# EAGLE design ISL8_XTOOLS (EAGLE 6.1)
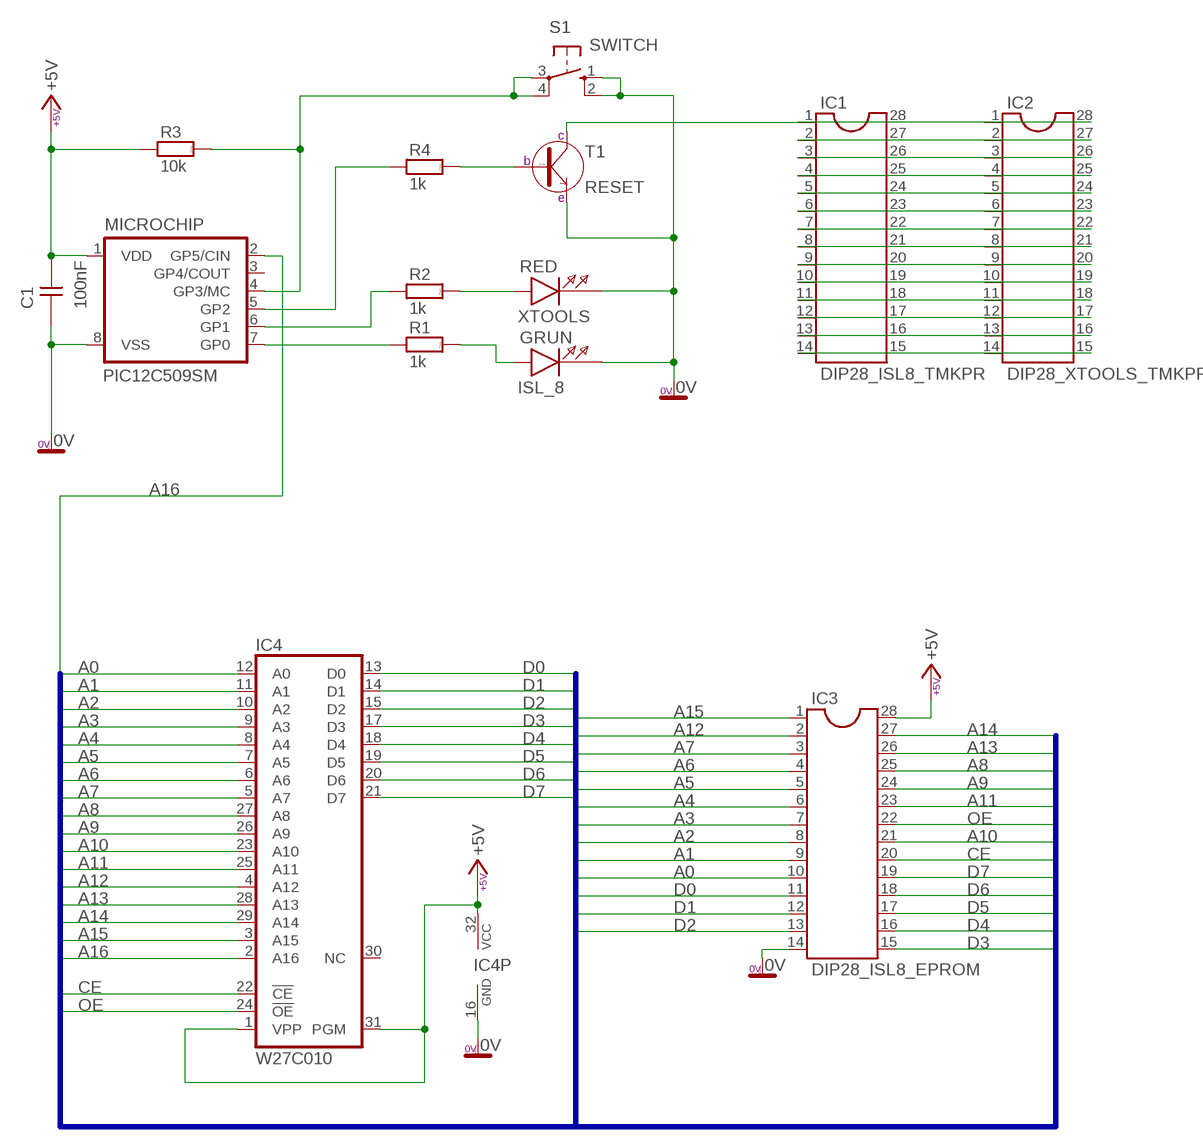
[diagram p0: schematic, sheet 1]

## Parts
C1  100nF  CK+  [1206]
GRUN  ISL_8  L-HSMG-C67  [HSMC670]
IC1  DIP28_ISL8_TMKPR  DIL28  [DIL28-6]
IC2  DIP28_XTOOLS_TMKPR  DIL28  [DIL28-6]
IC3  DIP28_ISL8_EPROM  DIL28  [DIL28-6]
IC4  W27C010  SST39VF010N  [PLCC32R]
MICROCHIP  PIC12C509SM  [SO-08M]
R1  1k  R_SMD_0805  [0805]
R2  1k  R_SMD_0805  [0805]
R3  10k  R_SMD_0805  [0805]
R4  1k  R_SMD_0805  [0805]
RED  XTOOLS  L-HSMG-C67  [HSMC670]
S1  SWITCH  10-XX  [B3F-10XX]
T1  RESET  BC846  [SOT-23]

## Nets
0V: C1.1 GRUN.K IC3.14 IC4.16(GND) MICROCHIP.8(VSS) RED.K S1.1(S) S1.2(S1) T1.2(E)
+5V: C1.2 IC3.28 IC4.1(VPP) IC4.31(PGM) IC4.32(VCC) MICROCHIP.1(VDD) R3.1
A0: IC3.10 IC4.12(A0)
A1: IC3.9 IC4.11(A1)
A2: IC3.8 IC4.10(A2)
A3: IC3.7 IC4.9(A3)
A4: IC3.6 IC4.8(A4)
A5: IC3.5 IC4.7(A5)
A6: IC3.4 IC4.6(A6)
A7: IC3.3 IC4.5(A7)
A8: IC3.25 IC4.27(A8)
A9: IC3.24 IC4.26(A9)
A10: IC3.21 IC4.23(A10)
A11: IC3.23 IC4.25(A11)
A12: IC3.2 IC4.4(A12)
A13: IC3.26 IC4.28(A13)
A14: IC3.27 IC4.29(A14)
A15: IC3.1 IC4.3(A15)
A16: IC4.2(A16) MICROCHIP.2(GP5/CIN)
CE: IC3.20 IC4.22(!CE)
D0: IC3.11 IC4.13(D0)
D1: IC3.12 IC4.14(D1)
D2: IC3.13 IC4.15(D2)
D3: IC3.15 IC4.17(D3)
D4: IC3.16 IC4.18(D4)
D5: IC3.17 IC4.19(D5)
D6: IC3.18 IC4.20(D6)
D7: IC3.19 IC4.21(D7)
N$1: IC1.1 IC2.1 T1.3(C)
N$2: MICROCHIP.7(GP0) R1.1
N$3: MICROCHIP.6(GP1) R2.1
N$4: R2.2 RED.A
N$5: GRUN.A R1.2
N$6: MICROCHIP.5(GP2) R4.1
N$7: MICROCHIP.4(GP3/MC) R3.2 S1.3(P) S1.4(P1)
N$8: IC1.2 IC2.2
N$9: IC1.3 IC2.3
N$10: IC1.4 IC2.4
N$11: IC1.5 IC2.5
N$12: R4.2 T1.1(B)
N$13: IC1.6 IC2.6
N$14: IC1.7 IC2.7
N$15: IC1.8 IC2.8
N$16: IC1.9 IC2.9
N$17: IC1.10 IC2.10
N$18: IC1.11 IC2.11
N$19: IC1.12 IC2.12
N$20: IC1.13 IC2.13
N$21: IC1.14 IC2.14
N$22: IC1.15 IC2.15
N$23: IC1.16 IC2.16
N$24: IC1.17 IC2.17
N$25: IC1.18 IC2.18
N$26: IC1.19 IC2.19
N$27: IC1.20 IC2.20
N$28: IC1.21 IC2.21
N$29: IC1.22 IC2.22
N$30: IC1.23 IC2.23
N$31: IC1.24 IC2.24
N$32: IC1.25 IC2.25
N$33: IC1.26 IC2.26
N$34: IC1.27 IC2.27
N$35: IC1.28 IC2.28
OE: IC3.22 IC4.24(!OE)
Unconnected: IC4.30(NC) MICROCHIP.3(GP4/COUT)

## Buses
BUS_ISL8,A0,A1,A2,A3,A4,A5,A6,A7,A8,A9,A10,A11,A12,A13,A14,A15,A16,D0,D1,D2,D3,D4,D5,D6,D7,OE,CE,WE

## Library data of the parts
C1 = #_GM99:CK+
GRUN RED = #_GM99:L-HSMG-C67
IC1-IC3 = ic-package:DIL28: Dual In Line
IC4 = memory:SST39VF010: 1 Mbit x8 Multi-Purpose Flash Source: http://www.sst.com/dotAsset/40782.pdf
MICROCHIP = microchip:PIC12C*?: MICROCONTROLLER; MF: MICROCHIP; MPN: PIC12C509A-04I/SM; OC_FARNELL: 9758844; OC_NEWARK: 65K1035
R1-R4 = #PaJa_30:R: Rezistor
S1 = switch-omron:10-XX: OMRON SWITCH; MPN: B3F-1000; OC_FARNELL: 176432; OC_NEWARK: 36M3542
T1 = #PaJa_30:BC846: SMD tranzistor - NPN - ekv. BC546

## Board
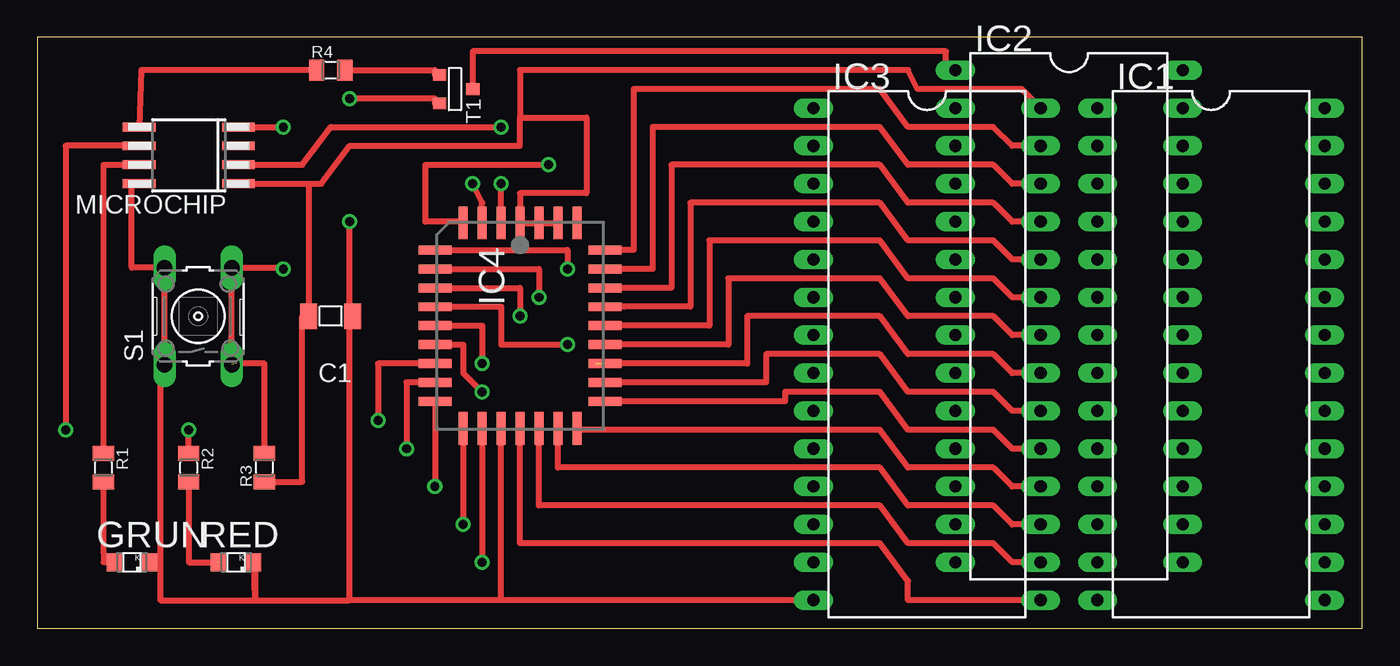
[diagram p1: board, top side]
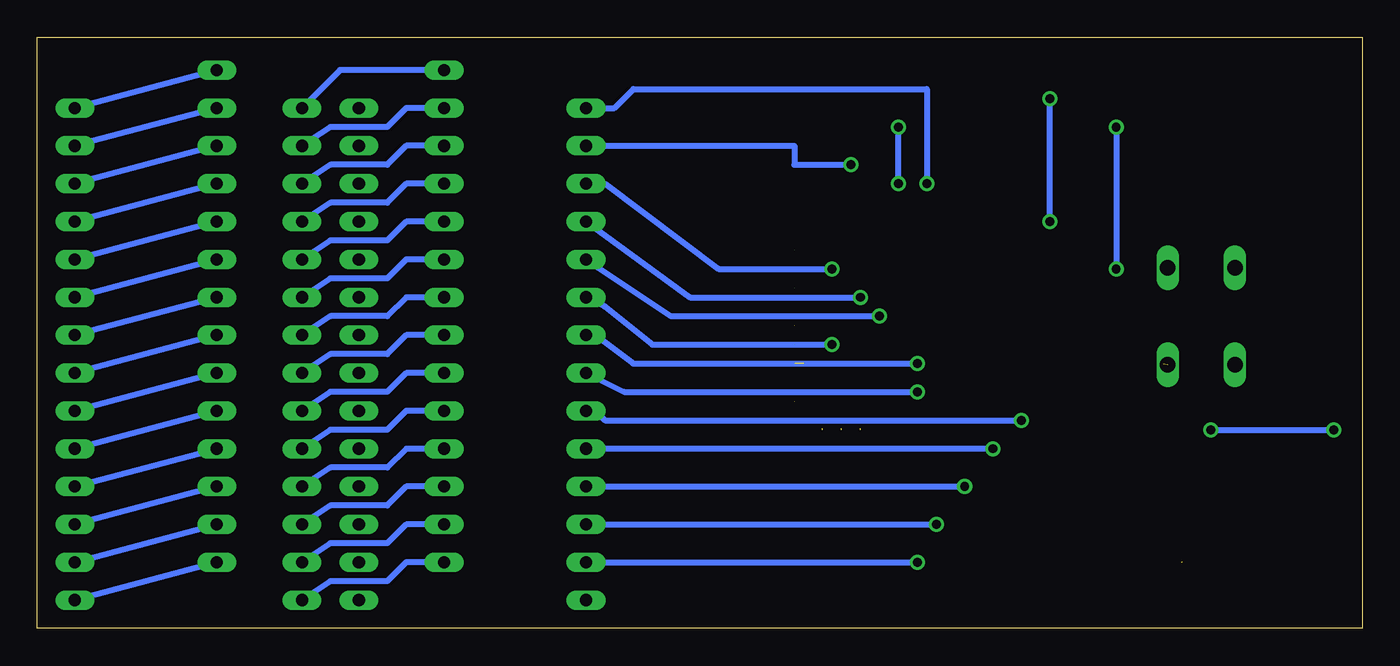
[diagram p2: board, bottom side, seen from below]

Size 88.88 x 39.67 mm. Coordinates in mm from the lower left corner, seen from the top.
Outline: 0,0 88.88,0 88.88,39.67 0,39.67 0,0
Copper layers (1*16): Top 0.035mm / dielectric 1.5mm / Bottom 0.035mm
Design rules: minimum track width 10mil, minimum drill 24mil, track to track 8mil, track to pad 8mil, pad to pad 8mil, via to via 8mil, smd to smd 8mil, copper to edge 40mil, drill to drill 8mil, minimum pad ring 10mil, minimum via ring 8mil, stop-mask expansion 4mil, vias tented up to drill 0mil, thermal gap 10mil

### Footprints (pad centres in the part's own frame; a part is rotated, then mirrored left to right if it is on the bottom)
1206 = smd 1.143 x 1.702: 1 -1.473,0; 2 1.473,0
HSMC670 = smd 1 x 1.2: A -1.2,0; K 1.2,0
DIL28-6 = drill 0.813 long: 1 -16.51,-7.62; 2 -13.97,-7.62; 3 -11.43,-7.62; 4 -8.89,-7.62; 5 -6.35,-7.62; 6 -3.81,-7.62; 7 -1.27,-7.62; 8 1.27,-7.62; 9 3.81,-7.62; 10 6.35,-7.62; 11 8.89,-7.62; 12 11.43,-7.62; 13 13.97,-7.62; 14 16.51,-7.62; 15 16.51,7.62; 16 13.97,7.62; 17 11.43,7.62; 18 8.89,7.62; 19 6.35,7.62; 20 3.81,7.62; 21 1.27,7.62; 22 -1.27,7.62; 23 -3.81,7.62; 24 -6.35,7.62; 25 -8.89,7.62; 26 -11.43,7.62; 27 -13.97,7.62; 28 -16.51,7.62
PLCC32R = smd 0.6 x 2.2: 1 0,6.9; 2 -1.27,6.9; 3 -2.54,6.9; 4 -3.81,6.9; 14 -3.81,-6.9; 15 -2.54,-6.9; 16 -1.27,-6.9; 17 0,-6.9; 18 1.27,-6.9; 19 2.54,-6.9; 20 3.81,-6.9; 30 3.81,6.9; 31 2.54,6.9; 32 1.27,6.9 | smd 2.2 x 0.6: 5 -5.7,5.08; 6 -5.7,3.81; 7 -5.7,2.54; 8 -5.7,1.27; 9 -5.7,0; 10 -5.7,-1.27; 11 -5.7,-2.54; 12 -5.7,-3.81; 13 -5.7,-5.08; 21 5.7,-5.08; 22 5.7,-3.81; 23 5.7,-2.54; 24 5.7,-1.27; 25 5.7,0; 26 5.7,1.27; 27 5.7,2.54; 28 5.7,3.81; 29 5.7,5.08
SO-08M = smd 0.6 x 2.2: 1 -1.905,-3.33; 2 -0.635,-3.33; 3 0.635,-3.33; 4 1.905,-3.33; 5 1.905,3.33; 6 0.635,3.33; 7 -0.635,3.33; 8 -1.905,3.33
0805 = smd 1.016 x 1.422: 1 -0.953,0; 2 0.953,0
B3F-10XX = drill 1.016 long: 1 -3.251,2.261; 2 3.251,2.261; 3 -3.251,-2.261; 4 3.251,-2.261
SOT-23 = smd 0.787 x 0.889: 1 -0.953,-0.953; 2 0.953,-0.953; 3 0,1.27

### Placement (x,y rotation side)
C1  19.68,20.96 180 top
GRUN  6.35,4.45 0 top
IC1  78.74,18.42 270 top
IC2  69.22,20.96 270 top
IC3  59.69,18.42 270 top
IC4  32.38,20.32 0 top
MICROCHIP  10.16,31.75 90 top
R1  4.45,10.79 270 top
R2  10.16,10.79 270 top
R3  15.24,10.79 90 top
R4  19.68,37.46 0 top
RED  13.34,4.45 0 top
S1  10.79,20.96 90 top
T1  27.94,36.2 270 top

### Tracks (layer width: path | path; a pad name or v marks a point on that pad's centre or on a via)
0V  (via drill 0.6)
  Top 0.406: 8.26,4.45 8.26,1.91 14.61,1.91 | 14.61,1.91 RED.K 14.61,4.45 14.61,1.91 | 14.61,1.91 20.95,1.91 | 20.95,1.91 20.95,20.96 | MICROCHIP.8 6.35,29.85 6.35,24.21 S1.2 S1.1 8.26,17.15 8.26,4.45 | C1.1 20.95,20.96 | 20.95,20.96 v20.95,27.31 | T1.2 26.67,35.24 26.67,35.56 v20.95,35.56 | 8.26,4.45 GRUN.K | 31.11,1.91 IC4.16 | IC3.14 31.11,1.91 | 31.11,1.91 20.95,1.91
  Bottom 0.406: v20.95,27.31 v20.95,35.56
+5V
  Top 0.406: R3.1 17.78,9.84 17.78,20.96 C1.2 | MICROCHIP.1 18.21,29.85 | 18.21,29.85 19.05,29.85 20.95,32.38 32.38,32.38 32.38,34.29 | 32.38,34.29 36.83,34.29 36.83,29.21 32.38,29.21 IC4.1 IC4.32 IC4.31 | C1.2 18.41,20.96 | 18.21,29.85 C1.2 | IC3.28 66.04,36.2 59.05,36.2 58.42,37.46 32.38,37.46 32.38,34.29
A0  (via drill 0.6)
  Top 0.406: v24.77,12.06 24.77,16.51 IC4.12
  Bottom 0.406: v24.77,12.06 IC3.10
A1  (via drill 0.6)
  Top 0.406: v22.86,13.97 22.86,17.78 IC4.11
  Bottom 0.406: IC3.9 51.44,14.61 50.8,13.97 v22.86,13.97
A2  (via drill 0.6)
  Top 0.406: IC4.10 28.57,19.05 28.57,17.15 v29.84,15.88
  Bottom 0.406: IC3.8 49.53,15.88 v29.84,15.88
A3  (via drill 0.6)
  Top 0.406: IC4.9 29.84,20.32 v29.84,17.78
  Bottom 0.406: IC3.7 51.44,19.69 48.9,17.78 v29.84,17.78
A4  (via drill 0.6)
  Top 0.406: IC4.8 31.11,21.59 31.11,19.05 v35.56,19.05
  Bottom 0.406: IC3.6 50.8,21.59 47.62,19.05 v35.56,19.05
A5  (via drill 0.6)
  Top 0.406: IC4.7 32.38,22.86 v32.38,20.96
  Bottom 0.406: IC3.5 46.35,20.96 v32.38,20.96
A6  (via drill 0.6)
  Top 0.406: IC4.6 33.66,24.13 v33.66,22.23
  Bottom 0.406: IC3.4 45.09,22.23 v33.66,22.23
A7  (via drill 0.6)
  Top 0.406: IC4.5 35.56,25.4 v35.56,24.13
  Bottom 0.406: IC3.3 50.8,29.85 43.18,24.13 v35.56,24.13
A8  (1 unrouted)
  Top 0.406: IC3.25 65.41,27.31 64.14,28.58 58.42,28.58 56.52,31.12 42.55,31.12 42.55,22.86 IC4.27
A9
  Top 0.406: IC3.24 65.41,24.77 64.14,26.04 58.42,26.04 56.52,28.58 43.81,28.58 43.81,21.59 39.37,21.59 IC4.26
A10  (1 unrouted)
  Top 0.406: IC3.21 65.41,17.15 64.14,18.42 58.42,18.42 56.52,20.96 47.62,20.96 47.62,17.78 37.47,17.78
A11  (1 unrouted)
  Top 0.406: IC3.23 65.41,22.23 64.14,23.5 58.42,23.5 56.52,26.04 45.09,26.04 45.09,20.32 IC4.25
A12  (via drill 0.6)
  Top 0.406: IC4.4 28.57,27.31 26.04,27.31 26.04,31.12 v34.29,31.12
  Bottom 0.406: IC3.2 38.1,32.38 38.1,31.12 v34.29,31.12
A13
  Top 0.406: IC3.26 65.41,29.85 64.14,31.12 58.42,31.12 56.52,33.66 41.27,33.66 41.27,24.13 IC4.28
A14  (1 unrouted)
  Top 0.406: IC3.27 65.41,32.38 64.14,33.66 58.42,33.66 56.52,36.2 40.01,36.2 40.01,25.4 IC4.29
A15  (via drill 0.6)
  Top 0.406: v29.21,29.85 29.84,28.58 IC4.3
  Bottom 0.406: v29.21,29.85 29.21,36.2 48.9,36.2 50.16,34.92 IC3.1
A16  (via drill 0.6)
  Top 0.406: MICROCHIP.2 17.78,31.12 19.68,33.66 v31.11,33.66 | IC4.2 v31.11,29.85
  Bottom 0.406: v31.11,29.85 v31.11,33.66
CE
  Top 0.406: IC3.20 65.41,14.61 64.14,15.88 58.42,15.88 56.52,18.42 48.9,18.42 48.9,16.51 40.64,16.51 40.01,16.51 39.37,16.51 IC4.22
D0  (via drill 0.6)
  Top 0.406: v26.67,9.53 IC4.13
  Bottom 0.406: IC3.11 v26.67,9.53
D1  (via drill 0.6)
  Top 0.406: IC4.14 v28.57,6.98
  Bottom 0.406: IC3.12 v28.57,6.98
D2  (via drill 0.6)
  Top 0.406: IC4.15 v29.84,4.45
  Bottom 0.406: IC3.13 v29.84,4.45
D3
  Top 0.406: IC3.15 58.42,1.91 58.42,3.17 56.52,5.71 32.38,5.71 IC4.17
D4  (1 unrouted)
  Top 0.406: IC3.16 65.41,4.45 64.14,5.71 58.42,5.71 56.52,8.26 33.66,8.26 33.66,13.33
D5  (1 unrouted)
  Top 0.406: IC3.17 65.41,6.98 64.14,8.26 58.42,8.26 56.52,10.79 34.92,10.79 34.92,13.33
D6  (1 unrouted)
  Top 0.406: IC3.18 65.41,9.53 64.14,10.79 58.42,10.79 56.52,13.33 36.2,13.33
D7  (1 unrouted)
  Top 0.406: IC3.19 65.41,12.06 64.14,13.33 58.42,13.33 56.52,15.88 50.16,15.88 50.16,15.24 IC4.21
N$1
  Top 0.406: IC2.1 60.96,37.46 60.96,38.73 29.21,38.73 T1.3
  Bottom 0.406: IC2.1 68.58,37.46 IC1.1
N$2
  Top 0.406: R1.1 4.45,31.12 MICROCHIP.7
N$3  (via drill 0.6)
  Top 0.406: MICROCHIP.6 1.91,32.38 v1.91,13.33 | R2.1 v10.16,13.33
  Bottom 0.406: v10.16,13.33 v1.91,13.33
N$4  (1 unrouted)
  Top 0.406: R2.2 10.16,4.45 12.06,4.45
N$5
  Top 0.406: GRUN.A 4.45,4.45 4.45,5.08 R1.2
N$6
  Top 0.406: R4.1 6.99,37.46 MICROCHIP.5
N$7  (via drill 0.6)  (1 unrouted)
  Top 0.406: S1.3 S1.4 16.51,24.21 v16.51,24.13 | MICROCHIP.4 v16.51,33.66 | R3.2 15.24,17.78 13.34,17.78
  Bottom 0.406: v16.51,33.66 v16.51,24.13
N$8
  Bottom 0.406: IC2.2 64.14,34.92 65.41,33.66 69.22,33.66 IC1.2
N$9
  Bottom 0.406: IC2.3 64.14,32.38 65.41,31.12 69.22,31.12 IC1.3
N$10
  Bottom 0.406: IC2.4 64.14,29.85 65.41,28.58 69.22,28.58 IC1.4
N$11
  Bottom 0.406: IC2.5 64.14,27.31 65.41,26.04 69.22,26.04 IC1.5
N$12
  Top 0.406: R4.2 26.67,37.46 26.67,37.15 T1.1
N$13
  Bottom 0.406: IC2.6 64.14,24.77 65.41,23.5 69.22,23.5 IC1.6
N$14
  Bottom 0.406: IC2.7 64.14,22.23 65.41,20.96 69.22,20.96 IC1.7
N$15
  Bottom 0.406: IC2.8 64.14,19.69 65.41,18.42 69.22,18.42 IC1.8
N$16
  Bottom 0.406: IC2.9 64.14,17.15 65.41,15.88 69.22,15.88 IC1.9
N$17
  Bottom 0.406: IC2.10 64.14,14.61 65.41,13.33 69.22,13.33 IC1.10
N$18
  Bottom 0.406: IC2.11 64.14,12.06 65.41,10.79 69.22,10.79 IC1.11
N$19
  Bottom 0.406: IC2.12 64.14,9.53 65.41,8.26 69.22,8.26 IC1.12
N$20
  Bottom 0.406: IC2.13 64.14,6.98 65.41,5.71 69.22,5.71 IC1.13
N$21
  Bottom 0.406: IC2.14 64.14,4.45 65.41,3.17 69.22,3.17 IC1.14
N$22
  Bottom 0.406: IC2.15 IC1.15
N$23
  Bottom 0.406: IC1.16 IC2.16
N$24
  Bottom 0.406: IC2.17 IC1.17
N$25
  Bottom 0.406: IC1.18 IC2.18
N$26
  Bottom 0.406: IC2.19 IC1.19
N$27
  Bottom 0.406: IC2.20 IC1.20
N$28
  Bottom 0.406: IC2.21 IC1.21
N$29
  Bottom 0.406: IC2.22 IC1.22
N$30
  Bottom 0.406: IC2.23 IC1.23
N$31
  Bottom 0.406: IC2.24 IC1.24
N$32
  Bottom 0.406: IC2.25 IC1.25
N$33
  Bottom 0.406: IC2.26 IC1.26
N$34
  Bottom 0.406: IC2.27 IC1.27
N$35
  Bottom 0.406: IC2.28 IC1.28
OE  (1 unrouted)
  Top 0.406: IC3.22 65.41,19.69 64.14,20.96 58.42,20.96 56.52,23.5 46.35,23.5 46.35,19.05 IC4.24